# Altium schematic sheet LEDs_Sheet.SchDoc
size A4; SheetNumber: 8; SheetTotal: 10
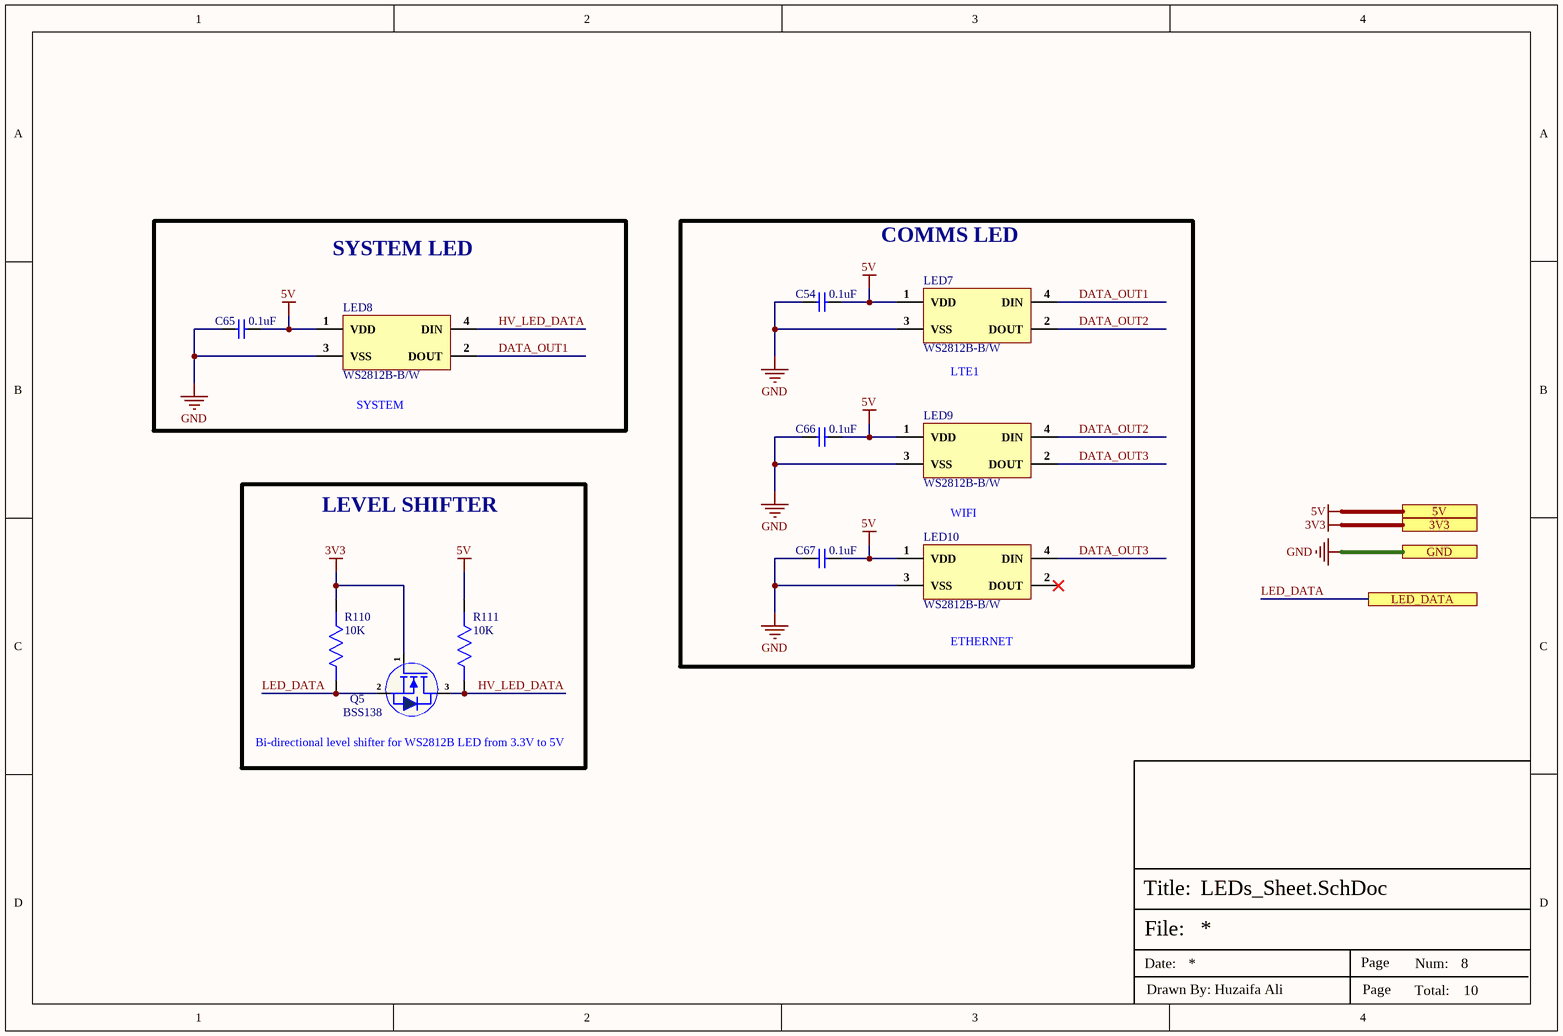
[diagram p0: LEDs_Sheet.SchDoc]

## Parts
C54  0.1uF  [Cap-0603]
C65  0.1uF  [Cap-0603]
C66  0.1uF  [Cap-0603]
C67  0.1uF  [Cap-0603]
LED7  WS2812B-B/W  [WS2812B-B/W]
LED8  WS2812B-B/W  [WS2812B-B/W]
LED9  WS2812B-B/W  [WS2812B-B/W]
LED10  WS2812B-B/W  [WS2812B-B/W]
Q5  BSS138  [Sot-23]
R110  10K  [Res-0603]
R111  10K  [Res-0603]

## Blocks framed on the sheet
SYSTEM LED: C65 LED8
COMMS LED: C54 C66 C67 LED7 LED9 LED10
LEVEL SHIFTER: Q5 R110 R111

## Ports
3V3, 5V, GND, LED_DATA

## Nets
3V3: Q5.1(G) R110.1 ; port 3V3
5V: C54.1 C65.1 C66.1 C67.1 LED7.1(VDD) LED8.1(VDD) LED9.1(VDD) LED10.1(VDD) R111.1 ; port 5V
GND: C54.2 C65.2 C66.2 C67.2 LED7.3(VSS) LED8.3(VSS) LED9.3(VSS) LED10.3(VSS) ; port GND
DATA_OUT1: LED7.4(DIN) LED8.2(DOUT)
DATA_OUT2: LED7.2(DOUT) LED9.4(DIN)
DATA_OUT3: LED9.2(DOUT) LED10.4(DIN)
HV_LED_DATA: LED8.4(DIN) Q5.3(D) R111.2
LED_DATA: Q5.2(S) R110.2 ; port LED_DATA

Not connected (* = marked no-connect by the designer): LED10 2(DOUT)*

## Notes on the sheet
- (near LED7) LTE1
- (near LED8) SYSTEM
- WIFI
- (near LED10) ETHERNET
- Bi-directional level shifter for WS2812B LED from 3.3V to 5V
- File:
- Title:
- Date:
- Page
- Num:
- Total:
- Drawn By: Huzaifa Ali

## Library data of the parts
C54 C65-C67 = CC0603KRX5R9BB104: CAP CER 0.1UF 50V X5R 0603; Manufacturer: Yageo; Capacitance: 100nF; Tolerance: 10%; Item Type: Capacitor; Supplier 1: Digi-Key; Manufacturer Part Number: CC0603KRX5R9BB104; RoHS: Yes; Category: Ceramic Capacitors; Stock 1: 152253; Pricing 1: 1=0.10000, 10=0.05200, 50=0.02820, 100=0.02310, 500=0.01648, 1000=0.01294 (USD); Mount: Surface Mount; Case/Package: 0603; Case Code (Imperial): 0603; Case Code (Metric): 1608; Weight: 7.1E-05oz; Min Operating Temperature: -55°C; Max Operating Temperature: 85°C; Packaging: Tape and Reel; Voltage Rating: 50V; Dielectric: X5R; Termination: SMD/SMT; Voltage Rating (DC): 50V; Package Quantity: 4000; Length: 0.063inch; Width: 0.031inch; Thickness: 0.035inch; Lead Free: Lead Free; Halogen Free: Halogen Free; ComponentLink1URL: http://www.mouser.com/ds/2/447/Yageo_UPY-GP_NP0_16V-to-50V_9-358835.pdf?src-supplier=Mouser; ComponentLink1Description: http://www.mouser.com/ds/2/447/Yageo_UPY-GP_NP0_16V-to-50V_9-358835.pdf?src-supplier=Mouser; ComponentLink2URL: https://www.yageo.com/upload/media/product/productsearch/datasheet/mlcc/UPY-GPHC_X5R_4V-to-50V_26.pdf?src-supplier=Digi-Key; ComponentLink2Description: https://www.yageo.com/upload/media/product/productsearch/datasheet/mlcc/UPY-GPHC_X5R_4V-to-50V_26.pdf?src-supplier=Digi-Key; ComponentLink3URL: http://www.yageo.com/exep/pages/download/literatures/ProductSelectionGuide%202014_Final_2.pdf?src-supplier=Digi-Key; ComponentLink3Description: http://www.yageo.com/exep/pages/download/literatures/ProductSelectionGuide%202014_Final_2.pdf?src-supplier=Digi-Key; Supplier Part Number 1: 311-4046-1-ND; LCSC Part Number: C110022
LED7-LED10 = WS2812B-B/W: RGB SMD5050 Light Emitting Diodes (LED) ROHS; Manufacturer: Worldsemi; Item Type: RGB LED; Manufacturer Part Number: WS2812B-B/W; Package: SMD5050; LCSC Part Number: C114586; ComponentLink1Description: LCSC; ComponentLink1URL: https://www.lcsc.com/product-detail/Light-Emitting-Diodes-LED_Worldsemi-WS2812B-B-W_C114586.html
Q5 = BSS138: 50V 220mA 3.5Ω@10V,220mA 225mW 1.6V@1mA N Channel SOT-23 MOSFETs ROHS; Manufacturer: Slkor(SLKORMICRO Elec.); Item Type: Mosfet; Manufacturer Part Number: BSS138; Package: SOT-23; LCSC Part Number: C426569; ComponentLink1Description: LCSC; ComponentLink1URL: https://www.lcsc.com/product-detail/MOSFETs_Slkor-SLKORMICRO-Elec-BSS138_C426569.html
R110 R111 = AC0603JR-0710KL: RES SMD 10K OHM 5% 1/10W 0603; Manufacturer: Yageo; Voltage Rating: 50V; Resistance: 10kR; Power Rating: 100mW; Temperature Coefficient: 100ppm/°C; Item Type: Resistor; Supplier 1: Future Electronics; Manufacturer Part Number: AC0603JR-0710KL; RoHS: Yes; Category: Chip SMD Resistors; Stock 1: 1533000; Pricing 1: 5000=0.00540 (USD); Case/Package: 0603; Case Code (Imperial): 0603; Case Code (Metric): 1608; Size Code: 0603; Min Operating Temperature: -55°C; Max Operating Temperature: 155°C; Packaging: Tape and Reel; Tolerance: 5%; Package Quantity: 1; Resistor Type: Thick Film; Termination: SMD/SMT; Number of Terminations: 2; Max Power Dissipation: 100mW; Features: Moisture Resistant,Automotive AEC-Q200,Anti-Sulfur; Series: AC; Construction: Rectangular; Length: 0.063inch; Width: 0.031inch; Height: 0.022inch; Depth: 0.8mm; Military Standard: Not; Lead Free: Lead Free; RoHS Compliant: Yes; ComponentLink1URL: https://datasheet.ciiva.com/5562/pyu-ac-51-rohs-l-2-5562553.pdf?src-supplier=Mouser; ComponentLink1Description: https://datasheet.ciiva.com/5562/pyu-ac-51-rohs-l-2-5562553.pdf?src-supplier=Mouser; Supplier Part Number 1: 1029044; LCSC Part Number: C140867